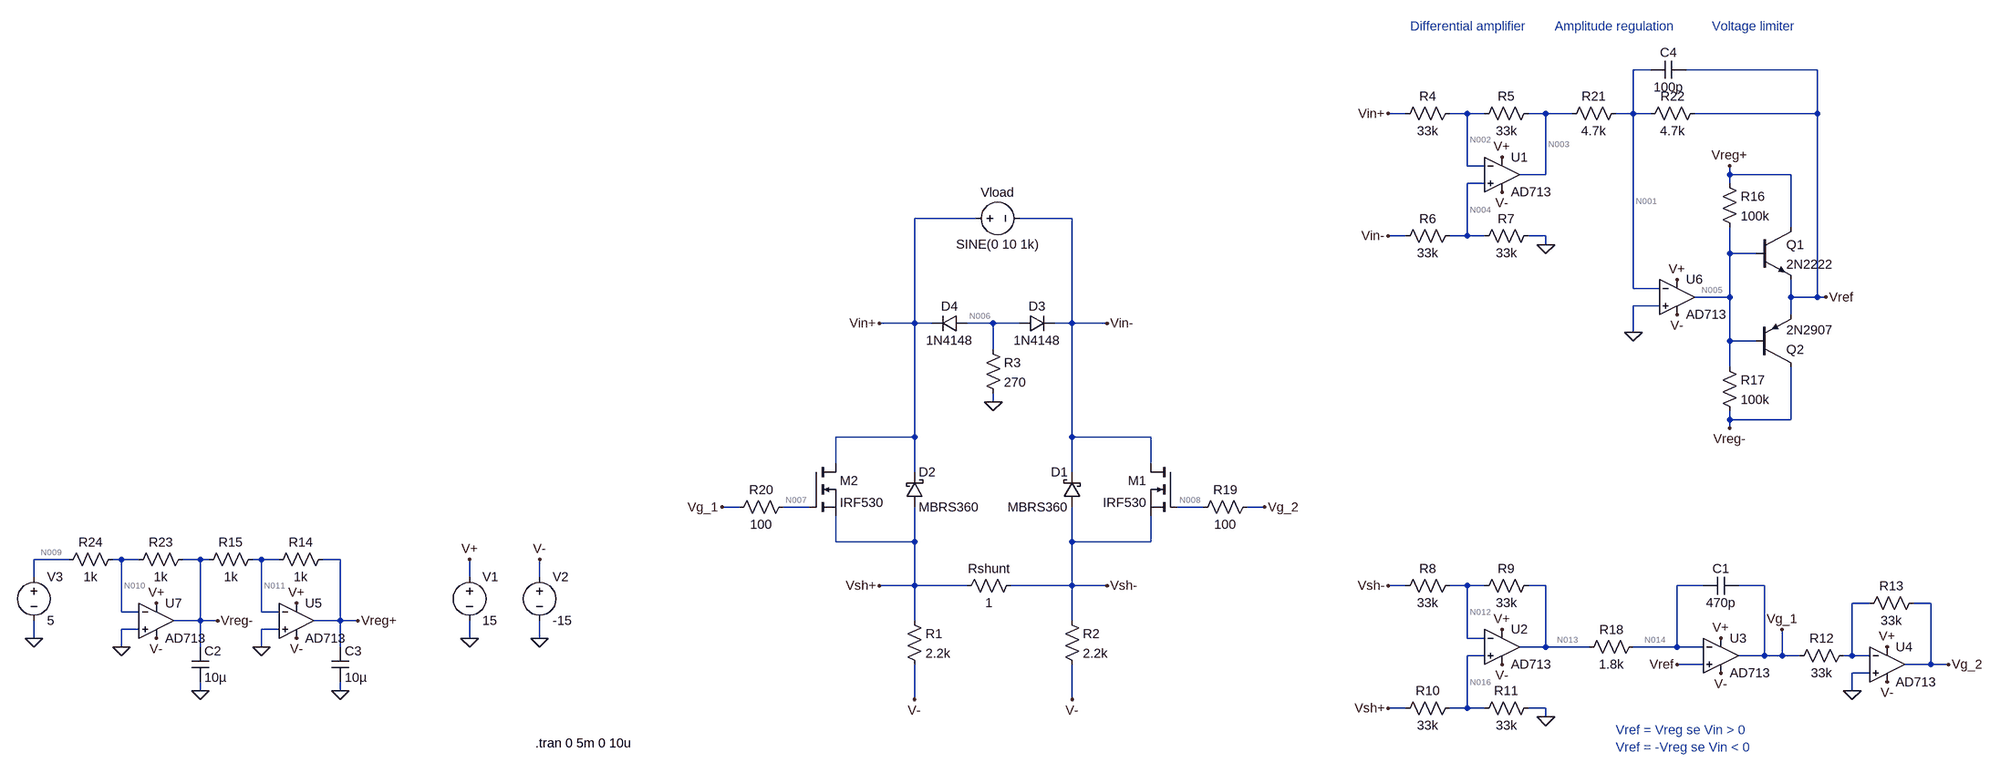
[diagram p0: schematic Electronic load.asc]
Electronic load.asc, the LTspice schematic file:
Version 4
SHEET 1 2652 896
WIRE 1120 -768 1088 -768
WIRE 1424 -768 1184 -768
WIRE 672 -688 640 -688
WIRE 784 -688 752 -688
WIRE 816 -688 784 -688
WIRE 928 -688 896 -688
WIRE 976 -688 928 -688
WIRE 1088 -688 1088 -768
WIRE 1088 -688 1056 -688
WIRE 1120 -688 1088 -688
WIRE 1424 -688 1424 -768
WIRE 1424 -688 1200 -688
WIRE 784 -592 784 -688
WIRE 816 -592 784 -592
WIRE 928 -576 928 -688
WIRE 928 -576 880 -576
WIRE 1264 -576 1264 -592
WIRE 1376 -576 1264 -576
WIRE 816 -560 784 -560
WIRE 1264 -560 1264 -576
WIRE -144 -496 -256 -496
WIRE 32 -496 -64 -496
WIRE 1376 -480 1376 -576
WIRE 672 -464 640 -464
WIRE 784 -464 784 -560
WIRE 784 -464 752 -464
WIRE 816 -464 784 -464
WIRE 928 -464 896 -464
WIRE 928 -448 928 -464
WIRE 1264 -432 1264 -480
WIRE 1312 -432 1264 -432
WIRE 1088 -368 1088 -688
WIRE 1136 -368 1088 -368
WIRE 1264 -352 1264 -432
WIRE 1264 -352 1200 -352
WIRE 1376 -352 1376 -384
WIRE 1424 -352 1424 -688
WIRE 1424 -352 1376 -352
WIRE 1440 -352 1424 -352
WIRE 1136 -336 1088 -336
WIRE 1376 -320 1376 -352
WIRE -256 -304 -256 -496
WIRE -256 -304 -320 -304
WIRE -224 -304 -256 -304
WIRE -112 -304 -160 -304
WIRE -64 -304 -112 -304
WIRE 32 -304 32 -496
WIRE 32 -304 0 -304
WIRE 96 -304 32 -304
WIRE 1088 -288 1088 -336
WIRE 1264 -272 1264 -352
WIRE 1312 -272 1264 -272
WIRE -112 -256 -112 -304
WIRE 1264 -224 1264 -272
WIRE -112 -160 -112 -176
WIRE 1264 -128 1264 -144
WIRE 1376 -128 1376 -224
WIRE 1376 -128 1264 -128
WIRE 1264 -112 1264 -128
WIRE -256 -96 -256 -304
WIRE -256 -96 -400 -96
WIRE 32 -96 32 -304
WIRE 176 -96 32 -96
WIRE -400 -48 -400 -96
WIRE 176 -48 176 -96
WIRE -256 -32 -256 -96
WIRE 32 -32 32 -96
WIRE -576 32 -608 32
WIRE -448 32 -496 32
WIRE 272 32 224 32
WIRE 384 32 352 32
WIRE -400 96 -400 48
WIRE -256 96 -256 32
WIRE -256 96 -400 96
WIRE 32 96 32 32
WIRE 176 96 176 48
WIRE 176 96 32 96
WIRE -2080 128 -2144 128
WIRE -1984 128 -2000 128
WIRE -1952 128 -1984 128
WIRE -1840 128 -1872 128
WIRE -1824 128 -1840 128
WIRE -1728 128 -1744 128
WIRE -1696 128 -1728 128
WIRE -1584 128 -1616 128
WIRE -2144 160 -2144 128
WIRE -1216 160 -1216 128
WIRE -1088 160 -1088 128
WIRE -256 176 -256 96
WIRE -256 176 -320 176
WIRE -160 176 -256 176
WIRE 32 176 32 96
WIRE 32 176 -80 176
WIRE 96 176 32 176
WIRE 672 176 640 176
WIRE 784 176 752 176
WIRE 816 176 784 176
WIRE 928 176 896 176
WIRE 1216 176 1168 176
WIRE 1328 176 1280 176
WIRE 1520 208 1488 208
WIRE 1632 208 1600 208
WIRE -1984 224 -1984 128
WIRE -1952 224 -1984 224
WIRE -1728 224 -1728 128
WIRE -1696 224 -1728 224
WIRE -1840 240 -1840 128
WIRE -1840 240 -1888 240
WIRE -1808 240 -1840 240
WIRE -1584 240 -1584 128
WIRE -1584 240 -1632 240
WIRE -1552 240 -1584 240
WIRE -256 240 -256 176
WIRE 32 240 32 176
WIRE -1952 256 -1984 256
WIRE -1696 256 -1728 256
WIRE -2144 272 -2144 240
WIRE -1216 272 -1216 240
WIRE -1088 272 -1088 240
WIRE 784 272 784 176
WIRE 816 272 784 272
WIRE -1984 288 -1984 256
WIRE -1840 288 -1840 240
WIRE -1728 288 -1728 256
WIRE -1584 288 -1584 240
WIRE 928 288 928 176
WIRE 928 288 880 288
WIRE 1008 288 928 288
WIRE 1168 288 1168 176
WIRE 1168 288 1088 288
WIRE 1216 288 1168 288
WIRE 816 304 784 304
WIRE 1328 304 1328 176
WIRE 1328 304 1280 304
WIRE 1360 304 1360 256
WIRE 1360 304 1328 304
WIRE 1392 304 1360 304
WIRE 1488 304 1488 208
WIRE 1488 304 1472 304
WIRE 1520 304 1488 304
WIRE 1216 320 1168 320
WIRE 1632 320 1632 208
WIRE 1632 320 1584 320
WIRE 1664 320 1632 320
WIRE 1520 336 1488 336
WIRE -1840 368 -1840 352
WIRE -1584 368 -1584 352
WIRE 1488 368 1488 336
WIRE -256 384 -256 320
WIRE 32 384 32 320
WIRE 672 400 640 400
WIRE 784 400 784 304
WIRE 784 400 752 400
WIRE 816 400 784 400
WIRE 928 400 896 400
WIRE 928 416 928 400
FLAG -1088 272 0
FLAG -1216 272 0
FLAG -1216 128 V+
FLAG -1088 128 V-
FLAG -256 384 V-
FLAG 32 384 V-
FLAG -112 -160 0
FLAG 848 -544 V-
FLAG 848 -608 V+
FLAG 928 -448 0
FLAG 848 320 V-
FLAG 848 256 V+
FLAG 928 416 0
FLAG -320 -304 Vin+
FLAG 96 -304 Vin-
FLAG -320 176 Vsh+
FLAG 96 176 Vsh-
FLAG 640 -688 Vin+
FLAG 640 -464 Vin-
FLAG 640 400 Vsh+
FLAG 640 176 Vsh-
FLAG 384 32 Vg_2
FLAG 1248 336 V-
FLAG 1248 272 V+
FLAG -2144 272 0
FLAG -1552 240 Vreg+
FLAG 1552 352 V-
FLAG 1552 288 V+
FLAG 1360 256 Vg_1
FLAG 1664 320 Vg_2
FLAG -608 32 Vg_1
FLAG 1488 368 0
FLAG -1664 272 V-
FLAG -1664 208 V+
FLAG -1728 288 0
FLAG -1808 240 Vreg-
FLAG 1264 -592 Vreg+
FLAG 1264 -112 Vreg-
FLAG 1168 -320 V-
FLAG 1168 -384 V+
FLAG 1440 -352 Vref
FLAG 1168 320 Vref
FLAG 1088 -288 0
FLAG -1920 272 V-
FLAG -1920 208 V+
FLAG -1984 288 0
FLAG -1840 368 0
FLAG -1584 368 0
SYMBOL voltage -1216 144 R0
SYMATTR InstName V1
SYMATTR Value 15
SYMBOL voltage -1088 144 R0
SYMATTR InstName V2
SYMATTR Value -15
SYMBOL nmos 224 -48 M0
SYMATTR InstName M1
SYMATTR Value IRF530
SYMBOL nmos -448 -48 R0
SYMATTR InstName M2
SYMATTR Value IRF530
SYMBOL schottky -272 32 M180
WINDOW 0 24 64 Left 2
WINDOW 3 24 0 Left 2
SYMATTR InstName D2
SYMATTR Value MBRS360
SYMATTR Description Diode
SYMATTR Type diode
SYMBOL res -176 192 R270
WINDOW 0 32 56 VTop 2
WINDOW 3 0 56 VBottom 2
SYMATTR InstName Rshunt
SYMATTR Value 1
SYMBOL res -272 224 R0
SYMATTR InstName R1
SYMATTR Value 2.2k
SYMBOL res 16 224 R0
SYMATTR InstName R2
SYMATTR Value 2.2k
SYMBOL diode -64 -320 M90
WINDOW 0 0 32 VBottom 2
WINDOW 3 32 32 VTop 2
SYMATTR InstName D3
SYMATTR Value 1N4148
SYMBOL diode -160 -288 M270
WINDOW 0 32 32 VTop 2
WINDOW 3 0 32 VBottom 2
SYMATTR InstName D4
SYMATTR Value 1N4148
SYMBOL res -128 -272 R0
SYMATTR InstName R3
SYMATTR Value 270
SYMBOL schottky 48 32 R180
WINDOW 0 24 64 Left 2
WINDOW 3 24 0 Left 2
SYMATTR InstName D1
SYMATTR Value MBRS360
SYMATTR Description Diode
SYMATTR Type diode
SYMBOL OpAmps\\AD713 848 -640 R0
SYMATTR InstName U1
SYMBOL res 768 -704 R90
WINDOW 0 0 56 VBottom 2
WINDOW 3 32 56 VTop 2
SYMATTR InstName R4
SYMATTR Value 33k
SYMBOL res 912 -704 R90
WINDOW 0 0 56 VBottom 2
WINDOW 3 32 56 VTop 2
SYMATTR InstName R5
SYMATTR Value 33k
SYMBOL res 768 -480 R90
WINDOW 0 0 56 VBottom 2
WINDOW 3 32 56 VTop 2
SYMATTR InstName R6
SYMATTR Value 33k
SYMBOL res 912 -480 R90
WINDOW 0 0 56 VBottom 2
WINDOW 3 32 56 VTop 2
SYMATTR InstName R7
SYMATTR Value 33k
SYMBOL OpAmps\\AD713 848 224 R0
SYMATTR InstName U2
SYMBOL res 768 160 R90
WINDOW 0 0 56 VBottom 2
WINDOW 3 32 56 VTop 2
SYMATTR InstName R8
SYMATTR Value 33k
SYMBOL res 912 160 R90
WINDOW 0 0 56 VBottom 2
WINDOW 3 32 56 VTop 2
SYMATTR InstName R9
SYMATTR Value 33k
SYMBOL res 768 384 R90
WINDOW 0 0 56 VBottom 2
WINDOW 3 32 56 VTop 2
SYMATTR InstName R10
SYMATTR Value 33k
SYMBOL res 912 384 R90
WINDOW 0 0 56 VBottom 2
WINDOW 3 32 56 VTop 2
SYMATTR InstName R11
SYMATTR Value 33k
SYMBOL voltage -160 -496 M90
WINDOW 0 -32 56 VBottom 2
WINDOW 3 32 56 VTop 2
WINDOW 123 0 0 Left 0
WINDOW 39 0 0 Left 0
SYMATTR InstName Vload
SYMATTR Value SINE(0 10 1k)
SYMBOL OpAmps\\AD713 1248 240 R0
SYMATTR InstName U3
SYMBOL voltage -2144 144 R0
WINDOW 123 0 0 Left 0
WINDOW 39 0 0 Left 0
SYMATTR InstName V3
SYMATTR Value 5
SYMBOL OpAmps\\AD713 1552 256 R0
SYMATTR InstName U4
SYMBOL res 1488 288 R90
WINDOW 0 0 56 VBottom 2
WINDOW 3 32 56 VTop 2
SYMATTR InstName R12
SYMATTR Value 33k
SYMBOL res 1616 192 R90
WINDOW 0 0 56 VBottom 2
WINDOW 3 32 56 VTop 2
SYMATTR InstName R13
SYMATTR Value 33k
SYMBOL res 368 16 R90
WINDOW 0 0 56 VBottom 2
WINDOW 3 32 56 VTop 2
SYMATTR InstName R19
SYMATTR Value 100
SYMBOL res -592 48 R270
WINDOW 0 32 56 VTop 2
WINDOW 3 0 56 VBottom 2
SYMATTR InstName R20
SYMATTR Value 100
SYMBOL cap 1280 160 R90
WINDOW 0 0 32 VBottom 2
WINDOW 3 32 32 VTop 2
SYMATTR InstName C1
SYMATTR Value 470p
SYMBOL res 1104 272 R90
WINDOW 0 0 56 VBottom 2
WINDOW 3 32 56 VTop 2
SYMATTR InstName R18
SYMATTR Value 1.8k
SYMBOL OpAmps\\AD713 -1664 176 R0
SYMATTR InstName U5
SYMBOL res -1600 112 R90
WINDOW 0 0 56 VBottom 2
WINDOW 3 32 56 VTop 2
SYMATTR InstName R14
SYMATTR Value 1k
SYMBOL res -1728 112 R90
WINDOW 0 0 56 VBottom 2
WINDOW 3 32 56 VTop 2
SYMATTR InstName R15
SYMATTR Value 1k
SYMBOL npn 1312 -480 R0
SYMATTR InstName Q1
SYMATTR Value 2N2222
SYMBOL pnp 1312 -224 M180
SYMATTR InstName Q2
SYMATTR Value 2N2907
SYMBOL res 1248 -576 R0
SYMATTR InstName R16
SYMATTR Value 100k
SYMBOL res 1248 -240 R0
SYMATTR InstName R17
SYMATTR Value 100k
SYMBOL OpAmps\\AD713 1168 -416 R0
SYMATTR InstName U6
SYMBOL res 1072 -704 R90
WINDOW 0 0 56 VBottom 2
WINDOW 3 32 56 VTop 2
SYMATTR InstName R21
SYMATTR Value 4.7k
SYMBOL res 1216 -704 R90
WINDOW 0 0 56 VBottom 2
WINDOW 3 32 56 VTop 2
SYMATTR InstName R22
SYMATTR Value 4.7k
SYMBOL OpAmps\\AD713 -1920 176 R0
SYMATTR InstName U7
SYMBOL res -1856 112 R90
WINDOW 0 0 56 VBottom 2
WINDOW 3 32 56 VTop 2
SYMATTR InstName R23
SYMATTR Value 1k
SYMBOL res -1984 112 R90
WINDOW 0 0 56 VBottom 2
WINDOW 3 32 56 VTop 2
SYMATTR InstName R24
SYMATTR Value 1k
SYMBOL cap -1856 288 R0
SYMATTR InstName C2
SYMATTR Value 10µ
SYMBOL cap -1600 288 R0
SYMATTR InstName C3
SYMATTR Value 10µ
SYMBOL cap 1184 -784 R90
WINDOW 0 0 32 VBottom 2
WINDOW 3 32 32 VTop 2
SYMATTR InstName C4
SYMATTR Value 100p
TEXT -1096 464 Left 2 !.tran 0 5m 0 10u
TEXT 1056 440 Left 2 ;Vref = Vreg se Vin > 0\nVref = -Vreg se Vin < 0
TEXT 1232 -848 Left 2 ;Voltage limiter
TEXT 944 -848 Left 2 ;Amplitude regulation
TEXT 680 -848 Left 2 ;Differential amplifier

The netlist it stands for:
* Electronic load.asc
V1 V+ 0 15
V2 V- 0 -15
M1 Vin- N008 Vsh- Vsh- IRF530
M2 Vin+ N007 Vsh+ Vsh+ IRF530
D2 Vsh+ Vin+ MBRS360
Rshunt Vsh+ Vsh- 1
R1 Vsh+ V- 2.2k
R2 Vsh- V- 2.2k
D3 N006 Vin- 1N4148
D4 N006 Vin+ 1N4148
R3 N006 0 270
D1 Vsh- Vin- MBRS360
XU1 N004 N002 V+ V- N003 AD712  ; AD713, pins In+ In- V+ V- OUT
R4 N002 Vin+ 33k
R5 N003 N002 33k
R6 N004 Vin- 33k
R7 0 N004 33k
XU2 N016 N012 V+ V- N013 AD712  ; AD713, pins In+ In- V+ V- OUT
R8 N012 Vsh- 33k
R9 N013 N012 33k
R10 N016 Vsh+ 33k
R11 0 N016 33k
Vload Vin+ Vin- SINE(0 10 1k)
XU3 Vref N014 V+ V- Vg_1 AD712  ; AD713, pins In+ In- V+ V- OUT
V3 N009 0 5
XU4 0 N015 V+ V- Vg_2 AD712  ; AD713, pins In+ In- V+ V- OUT
R12 N015 Vg_1 33k
R13 Vg_2 N015 33k
R19 Vg_2 N008 100
R20 Vg_1 N007 100
C1 Vg_1 N014 470p
R18 N014 N013 1.8k
XU5 0 N011 V+ V- Vreg+ AD712  ; AD713, pins In+ In- V+ V- OUT
R14 Vreg+ N011 1k
R15 N011 Vreg- 1k
Q1 Vreg+ N005 Vref 0 2N2222
Q2 Vreg- N005 Vref 0 2N2907
R16 Vreg+ N005 100k
R17 N005 Vreg- 100k
XU6 0 N001 V+ V- N005 AD712  ; AD713, pins In+ In- V+ V- OUT
R21 N001 N003 4.7k
R22 Vref N001 4.7k
XU7 0 N010 V+ V- Vreg- AD712  ; AD713, pins In+ In- V+ V- OUT
R23 Vreg- N010 1k
R24 N010 N009 1k
C2 Vreg- 0 10µ
C3 Vreg+ 0 10µ
C4 Vref N001 100p
.model D D
.lib standard.dio
.model NPN NPN
.model PNP PNP
.lib standard.bjt
.model NMOS NMOS
.model PMOS PMOS
.lib standard.mos
.tran 0 5m 0 10u
* Vref = Vreg se Vin > 0
* Vref = -Vreg se Vin < 0
* Voltage limiter
* Amplitude regulation
* Differential amplifier
.lib ADI1.lib
.backanno
.end

* Results of the author's LTspice run, read from the files saved beside the schematic
* Operating Point, zero values left out:
*   V(v+) = 15 V
*   V(v-) = -15 V
*   V(vin-) = -3.314 V
*   V(n008) = 3.496 µV
*   V(vsh-) = -3.942 V
*   V(vin+) = -3.314 V
*   V(n007) = -2.671 µV
*   V(vsh+) = -3.942 V
*   V(n006) = -2.655 V
*   V(n002) = -1.657 V
*   V(n004) = -1.657 V
*   V(n003) = -74.07 nV
*   V(n012) = -1.971 V
*   V(n016) = -1.971 V
*   V(n013) = -324.6 nV
*   V(n014) = -369.6 nV
*   V(vref) = -369.6 nV
*   V(vg_1) = -2.671 µV
*   V(n009) = 5 V
*   V(vg_2) = 3.496 µV
*   V(n011) = -10.55 µV
*   V(vreg+) = 5 V
*   V(vreg-) = -5 V
*   V(n005) = 162.9 mV
*   V(n001) = -280.6 nV
*   V(n010) = 11.56 µV
*   Ic(Q1) = 10.55 pA
*   Ib(Q1) = -4.65 pA
*   Ie(Q1) = -5.894 pA
*   Ic(Q2) = -5.166 pA
*   Ib(Q2) = 5.329 pA
*   Id(M1) = 4.944 mA
*   Is(M1) = -4.944 mA
*   Id(M2) = 4.944 mA
*   Is(M2) = -4.944 mA
*   I(D2) = -22.6 µA
*   I(D1) = -22.6 µA
*   I(D3) = 4.917 mA
*   I(D4) = 4.917 mA
*   I(Rshunt) = -236.5 nA
*   I(R1) = 5.027 mA
*   I(R2) = 5.027 mA
*   I(R3) = -9.833 mA
*   I(R4) = 50.21 µA
*   I(R5) = 50.21 µA
*   I(R6) = 50.21 µA
*   I(R7) = 50.21 µA
*   I(R8) = 59.72 µA
*   I(R9) = 59.72 µA
*   I(R10) = 59.72 µA
*   I(R11) = 59.72 µA
*   I(R12) = 80.94 pA
*   I(R13) = 105.9 pA
*   I(R18) = -25 pA
*   I(R14) = 5 mA
*   I(R15) = 5 mA
*   I(R16) = 48.37 µA
*   I(R17) = 51.63 µA
*   I(R21) = -43.94 pA
*   I(R22) = -18.94 pA
*   I(R23) = -5 mA
*   I(R24) = -5 mA
*   I(V1) = -38.95 mA
*   I(V2) = 53.89 mA
*   I(Vload) = 236.6 nA
*   I(V3) = -5 mA
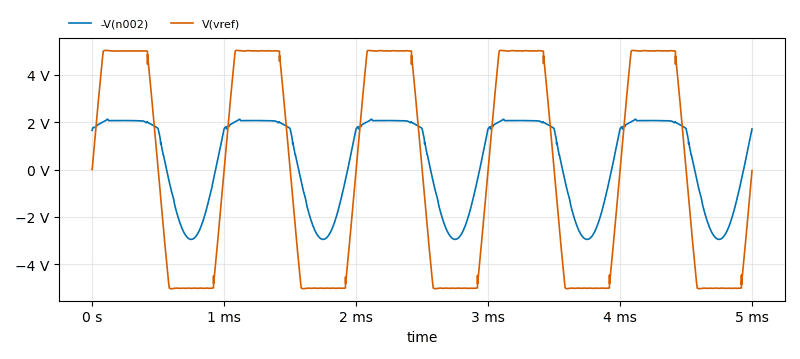
[diagram p1: Transient Analysis of Electronic load.asc, plotted from the saved traces]
* Transient Analysis, 1 run:
*   -V(n002): min -2.945 V, max 2.126 V, average 405.1 mV, rms 1.941 V, last 1.713 V
*   V(vref): min -5.031 V, max 5.032 V, average 1.467 mV, rms 4.429 V, last -40.28 mV